# EasyEDA Pro project jackt-tong-yong-xiao-che-kong-zhi-qi-zhuan-li-948f377a.epro, schematic v5.1SCH

## Sheets
1 v5.1电源: Board Name: GCARCv5; Create Date: 2024-10-29; Page Name: 电源; Project Name: 通用小车控制器; Schematic Name: v5SCH; Update Date: 2024-11-05; Company: 深圳嘉立创科技发展有限公司; Drawed: 嘉立创EDA; Page Size: A3; Part Number: JLCPCB-001; Reviewed: 嘉立创EDA; Version: V0.1
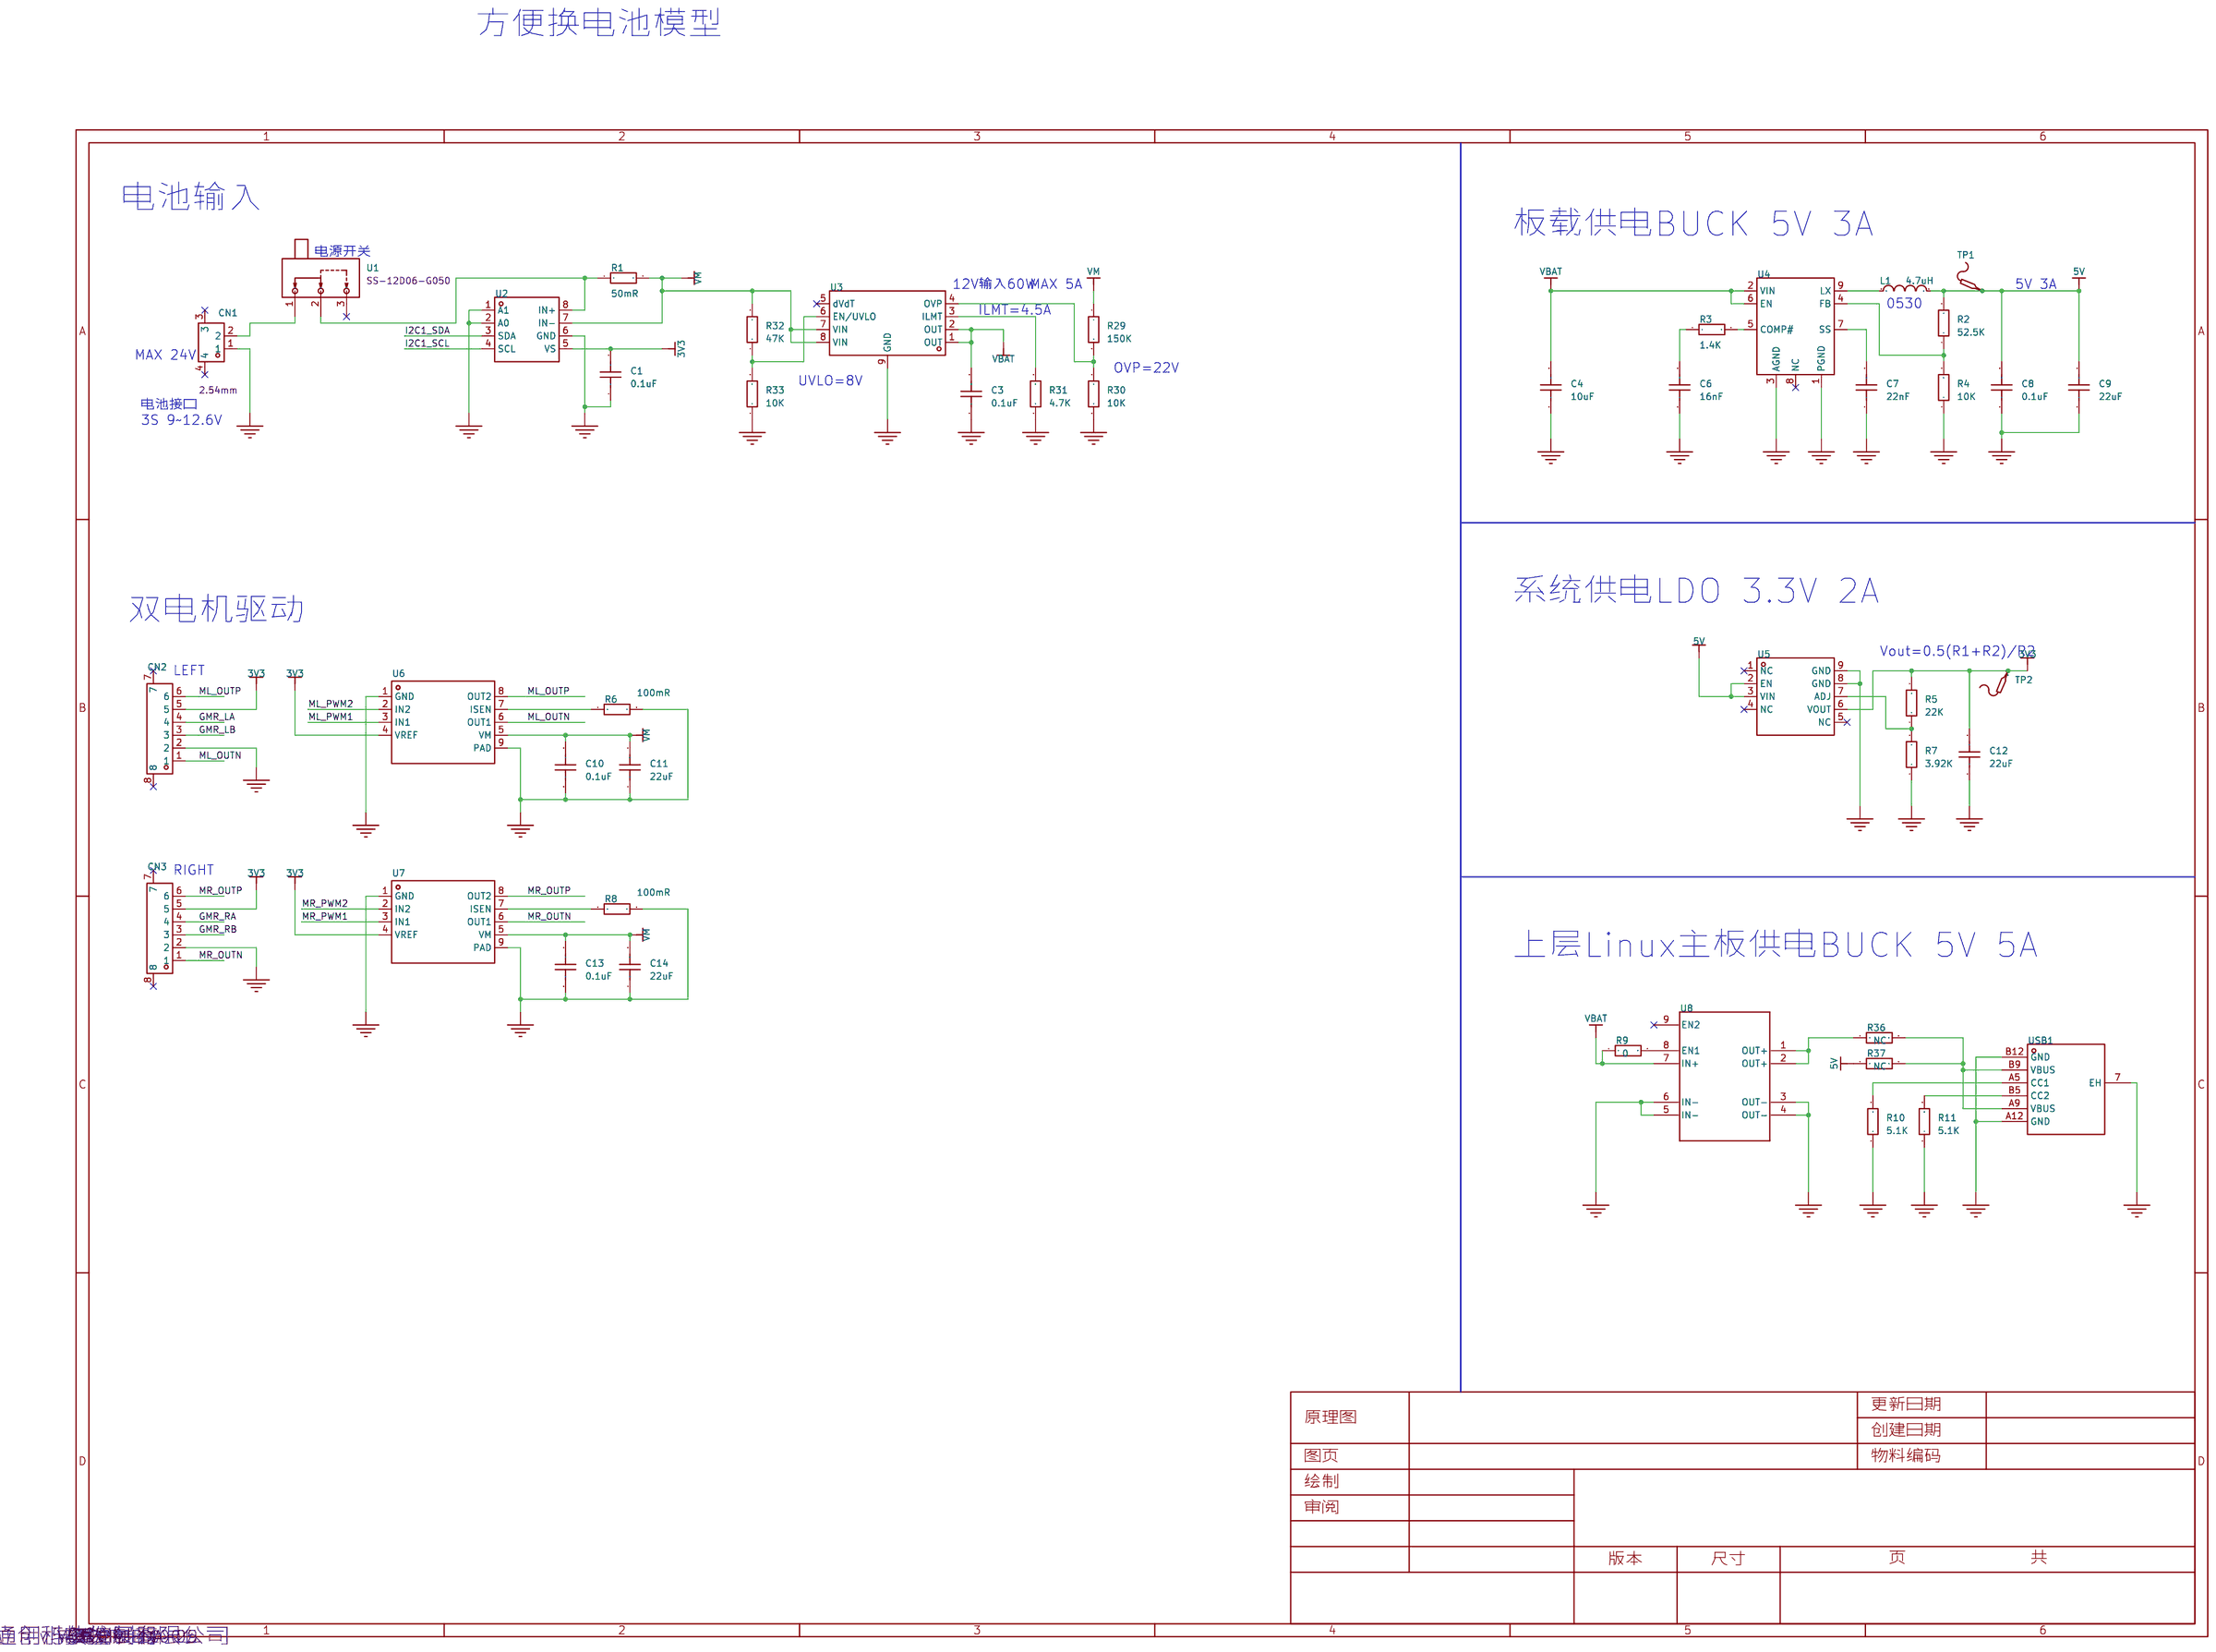
[diagram p2: v5.1电源]
2 v5.1功能: Board Name: GCARCv5_1; Create Date: 2024-11-23; Page Name: v5.1功能; Schematic Name: v5.1SCH; Update Date: 2024-11-28
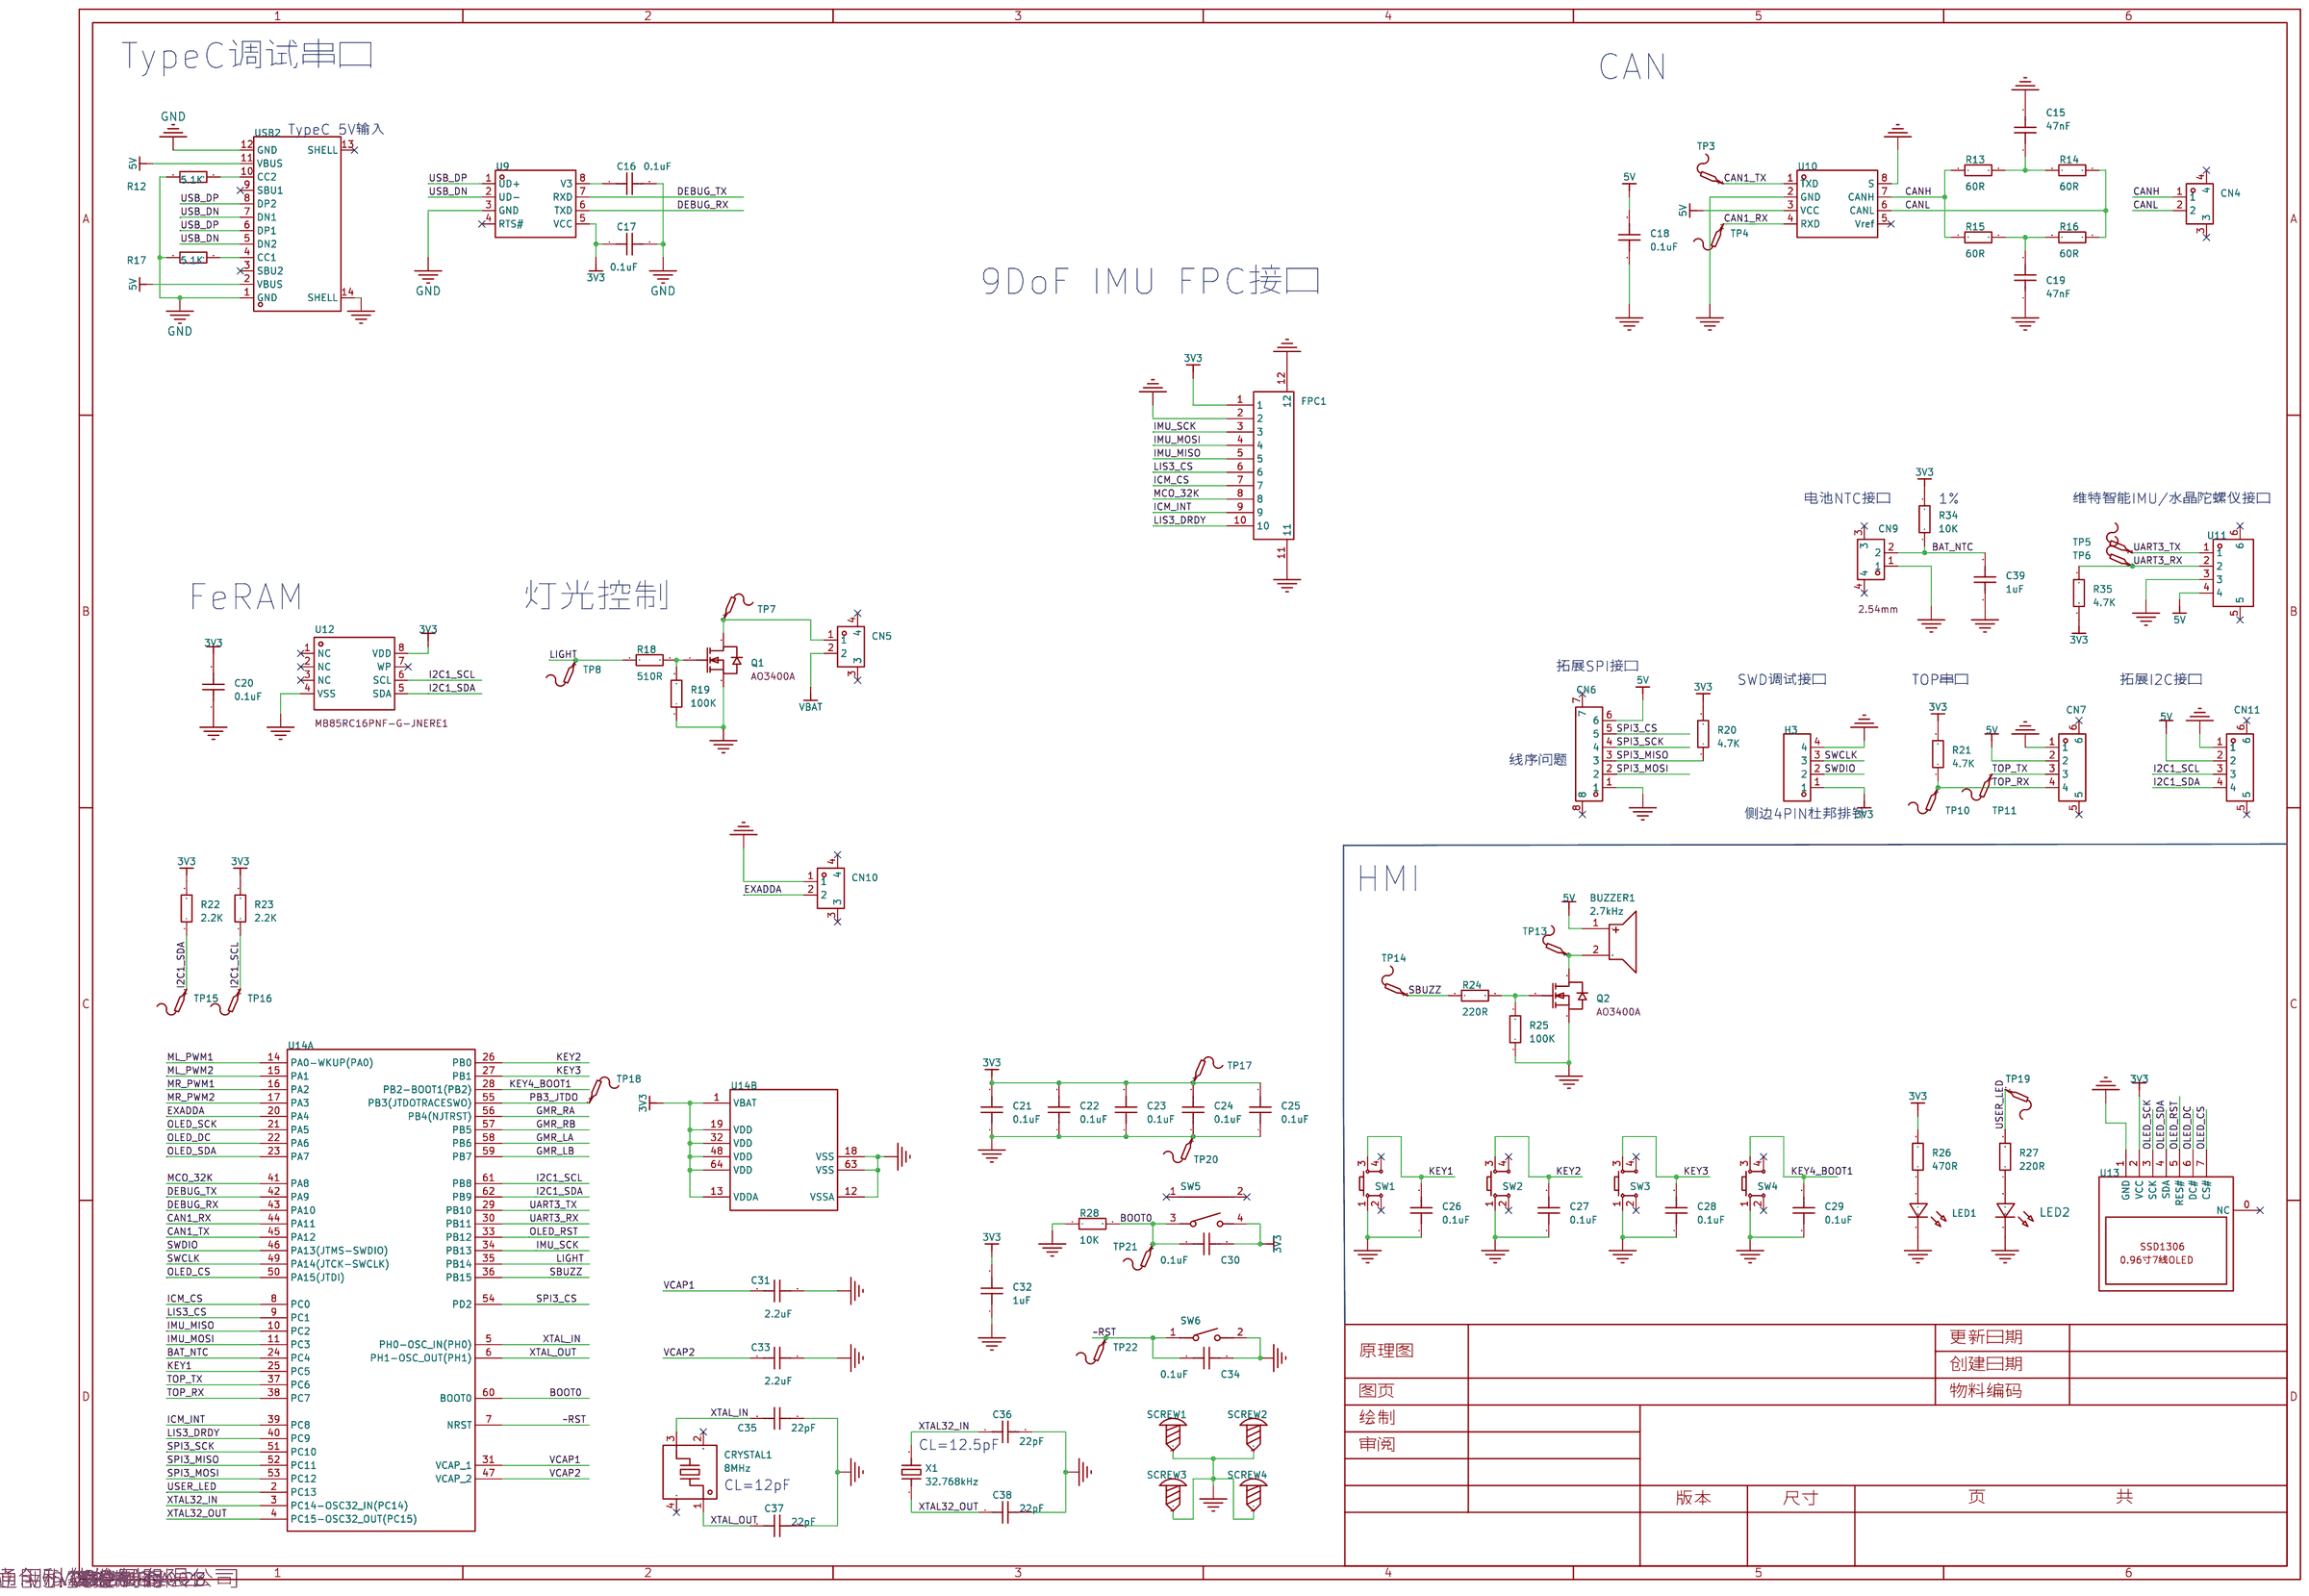
[diagram p3: v5.1功能]

## Parts
sheet v5.1功能
BUZZER1  2.7kHz  [BUZ-SMD_L9.6-W9.6-LS10.0-R]
C15  47nF  [C0603]
C16  0.1uF  [C0603]
C17  0.1uF  [C0603]
C18  0.1uF  [C0603]
C19  47nF  [C0603]
C20  0.1uF  [C0603]
C21  0.1uF  [C0603]
C22  0.1uF  [C0603]
C23  0.1uF  [C0603]
C24  0.1uF  [C0603]
C25  0.1uF  [C0603]
C26  0.1uF  [C0603]
C27  0.1uF  [C0603]
C28  0.1uF  [C0603]
C29  0.1uF  [C0603]
C30  0.1uF  [C0603]
C31  2.2uF  [C0603]
C32  1uF  [C0603]
C33  2.2uF  [C0603]
C34  0.1uF  [C0603]
C35  22pF  [C0603]
C36  22pF  [C0603]
C37  22pF  [C0603]
C38  22pF  [C0603]
C39  1uF  [C0603]
CN4  ZX-XH2.54-2PWT  [CONN-SMD_2P-P2.54_MEGASTAR_ZX-XH2.54-2PWT]
CN5  ZX-XH2.54-2PWT  [CONN-SMD_2P-P2.54_MEGASTAR_ZX-XH2.54-2PWT]
CN6  HCZZ0021-6  [CONN-SMD_HCZZ0021-6]
CN7  XDWF-2500-04P  [CONN-SMD_4P-P2.54_MXXH-2.54-04P-WT1-0-A]
CN9  ZX-XH2.54-2PWT  [CONN-SMD_2P-P2.54_MEGASTAR_ZX-XH2.54-2PWT]
CN10  ZX-XH2.54-2PWT  [CONN-SMD_2P-P2.54_MEGASTAR_ZX-XH2.54-2PWT]
CN11  XDWF-2500-04P  [CONN-SMD_4P-P2.54_MXXH-2.54-04P-WT1-0-A]
CRYSTAL1  8MHz  [CRYSTAL-SMD_4P-L3.2-W2.5-BL_SIT8008BI]
FPC1  AFC01-S10FCA-00  [FPC-SMD_P0.5-10P_FGS-XJ-H2.0]
H3  PZ254R-11-04P  [HDR-TH_4P-P2.54-H-M-W10.4]
LED1  -  [LED_0603]
LED2  -  [LED_0603]
Q1  AO3400A  [SOT-23-3_L2.9-W1.6-P1.90-LS2.8-BR]
Q2  AO3400A  [SOT-23-3_L2.9-W1.6-P1.90-LS2.8-BR]
R12  5.1K  [R0603]
R13  60R  [R0603]
R14  60R  [R0603]
R15  60R  [R0603]
R16  60R  [R0603]
R17  5.1K  [R0603]
R18  510R  [R0603]
R19  100K  [R0603]
R20  4.7K  [R0603]
R21  4.7K  [R0603]
R22  2.2K  [R0603]
R23  2.2K  [R0603]
R24  220R  [R0603]
R25  100K  [R0603]
R26  470R  [R0603]
R27  220R  [R0603]
R28  10K  [R0603]
R34  10K  [R0603]
R35  4.7K  [R0603]
SCREW1  -  [M3螺丝]
SCREW2  -  [M3螺丝]
SCREW3  -  [M3螺丝]
SCREW4  -  [M3螺丝]
SW1  -  [SW-TH_4P-L6.0-W6.0-P4.50-LS6.5]
SW2  -  [SW-TH_4P-L6.0-W6.0-P4.50-LS6.5]
SW3  -  [SW-TH_4P-L6.0-W6.0-P4.50-LS6.5]
SW4  -  [SW-TH_4P-L6.0-W6.0-P4.50-LS6.5]
SW5  TS24CA  [SW-SMD_TS24CA]
SW6  TS-1088-AR02016  [SW-SMD_L3.9-W3.0-P4.45]
TP3  -  [Test-Point-0.5mm]
TP4  -  [Test-Point-0.5mm]
TP5  -  [Test-Point-0.5mm]
TP6  -  [Test-Point-0.5mm]
TP7  -  [Test-Point-0.5mm]
TP8  -  [Test-Point-0.5mm]
TP10  -  [Test-Point-0.5mm]
TP11  -  [Test-Point-0.5mm]
TP13  -  [Test-Point-0.5mm]
TP14  -  [Test-Point-0.5mm]
TP15  -  [Test-Point-0.5mm]
TP16  -  [Test-Point-0.5mm]
TP17  -  [Test-Point-0.5mm]
TP18  -  [Test-Point-0.5mm]
TP19  -  [Test-Point-0.5mm]
TP20  -  [Test-Point-0.5mm]
TP21  -  [Test-Point-0.5mm]
TP22  -  [Test-Point-0.5mm]
U9  CH340N  [SOP-8_L4.9-W3.9-P1.27-LS6.0-BL]
U10  TJA1050T-JSM  [SOIC-8_L4.9-W3.9-P1.27-LS6.0-BL]
U11  WAFER-GH1.25-4PWB  [CONN-SMD_4P-P1.25_XUNPU_WAFER-GH1.25-4PWB]
U12  MB85RC16PNF-G-JNERE1  [SOIC-8_L4.9-W3.9-P1.27-LS6.0-BL]
U13  -  [0.96寸7针OLED]
U14  STM32F405RGT6  [LQFP-64_L10.0-W10.0-P0.50-LS12.0-BL]  (sections 1,2)
USB2  TYPE-C 16PIN 2MD(073)  [USB-C-SMD_TYPE-C-6PIN-2MD-073]
X1  32.768kHz  [OSC-SMD_L3.2-W1.5]
sheet v5.1电源
C1  0.1uF  [C0603]
C3  0.1uF  [C0603]
C4  10uF  [C0805]
C6  16nF  [C0603]
C7  22nF  [C0603]
C8  0.1uF  [C0603]
C9  22uF  [C0805]
C10  0.1uF  [C0603]
C11  22uF  [C1206]
C12  22uF  [C0805]
C13  0.1uF  [C0603]
C14  22uF  [C1206]
CN1  ZX-XH2.54-2PWT  [CONN-SMD_2P-P2.54_MEGASTAR_ZX-XH2.54-2PWT]
CN2  HCZZ0021-6  [CONN-SMD_HCZZ0021-6]
CN3  HCZZ0021-6  [CONN-SMD_HCZZ0021-6]
L1  4.7uH  [IND-SMD_L5.4-W5.2_FXL0530]
R1  50mR  [R1206]
R2  52.5K  [R0603]
R3  1.4K  [R0603]
R4  10K  [R0603]
R5  22K  [R0603]
R6  100mR  [R1206]
R7  3.92K  [R0603]
R8  100mR  [R1206]
R9  0  [R0402]
R10  5.1K  [R0603]
R11  5.1K  [R0603]
R29  150K  [R0603]
R30  10K  [R0603]
R31  4.7K  [R0603]
R32  47K  [R0603]
R33  10K  [R0603]
R36  NC  [R0402]
R37  NC  [R0402]
TP1  -  [Test-Point-0.5mm]
TP2  -  [Test-Point-0.5mm]
U1  SS-12D06-G050  [SW-TH_3P-P4.70_SS-12D06-G050]
U2  INA219AID  [SOIC-8_L4.9-W3.9-P1.27-LS6.0-BL]
U3  MX25947ES  [ESOP-8_L4.9-W3.9-P1.27-LS6.0-BL-EP-1]
U4  ME3118ASPG  [ESOP-8_L4.9-W3.9-P1.27-LS6.0-BL-EP]
U5  RT2515HGSP  [SOP-8_L4.9-W3.9-P1.27-LS6.0-BL-EP]
U6  DRV8870DDAR  [HSOP-8_L5.0-W4.0-P1.27-LS6.2-BL-EP]
U7  DRV8870DDAR  [HSOP-8_L5.0-W4.0-P1.27-LS6.2-BL-EP]
U8  XN-50L  [小聂studio-5V稳压]
USB1  TYPE-C 6P(073)  [TYPE-C-SMD_TYPE-C-6P_5]

## Library data of the parts
BUZZER1 = MLT-9650: 驱动方式:有源(内含驱动线路);构造类型:电磁式;频率:2.7kHz;声压(SPL):85dB@5V,10cm;; LCSC Part Name: 耐环保MLT-9650; Supplier Part: C96127; Manufacturer: 华能; JLCPCB Part Class: 扩展库; Datasheet: https://atta.szlcsc.com/upload/public/pdf/source/20170914/C96127_1505374148680969227.pdf; Supplier: LCSC; Oscillator Circuit: 有源(内含驱动线路); Technology Type: 电磁式; Operating Voltage: 3V~7V; Sound Pressure Level (SPL): 85dB@5V,10cm; Length: 9.6mm; Width: 9.6mm; Height: 5.5mm
C1 C3 C6-C8 C10 C13 C15-C39 = CAP_0603: Supplier Footprint: 0603
CN1 CN4 CN5 CN9 CN10 = ZX-XH2.54-2PWT: 插针结构:1x2P;间距:2.54mm;安装方式:卧贴;参考系列:XH;总PIN数:2P;排数:1;每排PIN数:2;行距:-;额定电流:3A;触头材质:黄铜;触头镀层:锡;工作温度范围:-25℃~+85℃;; Supplier Part: C7429671; Manufacturer: Megastar(兆星); Supplier Footprint: SMD,P=2.54mm,卧贴; JLCPCB Part Class: 扩展库; Datasheet: https://atta.szlcsc.com/upload/public/pdf/source/20230619/D2020A0565D707024C90AEAD14B7AF42.pdf; Supplier: LCSC; Pins Structure: 1x2P; Pitch: 2.54mm; Mounting Style: 卧贴; Reference Series: XH; Number of Pins: 2P; Number of Rows: 1; Number of PINs Per Row: 2; Current Rating (Max): 3A; Contact Material: 黄铜; Contact Plating: 锡; Operating Temperature Range: -25℃~+85℃
CN2 CN3 CN6 = HCZZ0021-6: 插针结构:1x6P;间距:2.54mm;安装方式:卧贴;参考系列:XH;总PIN数:6P;排数:1;每排PIN数:6;额定电流:3A;触头材质:黄铜;触头镀层:锡;工作温度范围:-25℃~+85℃;; LCSC Part Name: 1x6P 间距:2.54mm 卧贴 系列:XH 米色; Supplier Part: C7433711; Manufacturer: HC(虹成电子); Supplier Footprint: SMD,P=2.54mm,卧贴; JLCPCB Part Class: 扩展库; Datasheet: https://atta.szlcsc.com/upload/public/pdf/source/20230707/EBD34B2F45667F1DC530D7576BB95823.pdf; Supplier: LCSC; Pins Structure: 1x6P; Pitch: 2.54mm; Mounting Style: 卧贴; Reference Series: XH; Number of Pins: 6P; Number of Rows: 1; Number of PINs Per Row: 6; Current Rating (Max): 3A; Contact Material: 黄铜; Contact Plating: 锡; Operating Temperature Range: -25℃~+85℃
CN7 CN11 = XDWF-2500-04P: 间距:2.54mm;安装方式:卧贴;参考系列:XH;总PIN数:4P;额定电流:4A;工作温度范围:-40℃~+85℃;; LCSC Part Name: 间距:2.54mm 卧贴 系列:XH; Supplier Part: C19723931; Manufacturer: LX(连欣科技); Supplier Footprint: SMD,P=2.5mm,卧贴; JLCPCB Part Class: 扩展库; Datasheet: https://atta.szlcsc.com/upload/public/pdf/source/20231222/6CB0E40CA6FFE63C5D87C69622E580AB.pdf; Supplier: LCSC; Pitch: 2.54mm; Mounting Style: 卧贴; Reference Series: XH; Number of Pins: 4P; Current Rating (Max): 4A; Operating Temperature Range: -40℃~+85℃
CRYSTAL1 = CF4008M00012001: 晶振类型:贴片晶振;频率:8MHz;常温频差:±10ppm;外接负载电容:12pF;频率稳定度(全温):±30ppm;; LCSC Part Name: 8MHz ±10ppm 12pF; Supplier Part: C7294546; Manufacturer: HUAXIN(华昕); Supplier Footprint: SMD-3225-4P; JLCPCB Part Class: 扩展库; Datasheet: https://atta.szlcsc.com/upload/public/pdf/source/20230614/403FD538918E19EFAFACD07D4A487DFF.pdf; Supplier: LCSC; Crystal Type: 贴片晶振; Normal temperature Frequency Tolerance: ±10ppm; External load capacitor: 12pF; Frequency Stability(Full temperature range): ±30ppm; Equivalent Series Resistance (ESR): 40Ω; Operating Temperature: -40℃~+85℃
FPC1 = AFC01-S10FCA-00: 锁定特性:翻盖式;触点类型:下接;触点数量:10P;间距:0.5mm;安装类型:卧贴;; LCSC Part Name: 间距:0.5mm P数:10P 翻盖式 下接; Supplier Part: C262659; Manufacturer: JS(钜硕电子); Supplier Footprint: SMD,P=0.5mm,卧贴; JLCPCB Part Class: 扩展库; Datasheet: https://atta.szlcsc.com/upload/public/pdf/source/20190816/C413942_2A72D1AC756EAE17EEDF756A339D4500.pdf; Supplier: LCSC; Locking Feature: 翻盖式; Contact Type: 下接; Number of Contacts: 10P; Pitch: 0.5mm; Mounting Type: 卧贴; FFC, FCB Thickness: 0.3mm; Height Above Board: 2mm
H3 = PZ254R-11-04P: 插针结构:1x4P;间距:2.54mm;行距:-;圆针/方针:方针;安装类型:弯插;排数:单排;总PIN位数:4P;额定电流:-;额定电压:-;配合针长度:6mm;塑高:2.5mm;触头材质:黄铜;触头镀层:-;工作温度范围:-40℃~+105℃;颜色:黑色;; LCSC Part Name: 间距:2.54mm 1x4P 弯插 方针; Supplier Part: C492412; Manufacturer: XFCN(兴飞); Supplier Footprint: 弯插,P=2.54mm; JLCPCB Part Class: 扩展库; Datasheet: https://atta.szlcsc.com/upload/public/pdf/source/20200309/C492412_B0EFFC1946AB079B8871416C4A09EF6C.pdf; Supplier: LCSC; Pin Structure: 1x4P; Pitch: 2.54mm; Circluar Pins/Square Pins: 方针; Mounting Type: 弯插; Number of Rows: 单排; Number of Pins: 4P; Length of Mating Pin: 6mm; Insulation Height: 2.5mm; Contact Material: 黄铜; Operating Temperature Range: -40℃~+105℃; Color: 黑色
LED1 = LED_0603-G: Supplier Footprint: 0603
LED2 = LED_0603-R: Supplier Footprint: 0603
Q1 Q2 = AO3400A_C20917: 类型:1个N沟道;漏源电压(Vdss):30V;连续漏极电流(Id):5.7A;功率(Pd):1.4W;导通电阻(RDS(on)@Vgs,Id):26.5mΩ@10V,5.7A;阈值电压(Vgs(th)@Id):1.5V@250uA;; LCSC Part Name: 1个N沟道 耐压:30V 电流:5.7A; Supplier Part: C20917; Manufacturer: AOS; Supplier Footprint: SOT-23-3L; JLCPCB Part Class: 基础库; Datasheet: https://atta.szlcsc.com/upload/public/pdf/source/20140107/1457706668533.pdf; Supplier: LCSC; Type: 1个N沟道; Drain Source Voltage (Vdss): 30V; Continuous Drain Current (Id): 5.7A; Power Dissipation (Pd): 1.4W; Drain Source On Resistance (RDS(on)@Vgs,Id): 26.5mΩ@10V,5.7A; Gate Threshold Voltage (Vgs(th)@Id): 1.5V@250uA; Total Gate Charge (Qg@Vgs): 7nC@4.5V; Input Capacitance (Ciss@Vds): 630pF@15V; Operating Temperature: -55℃~+150℃@(Tj)
R2-R5 R7 R10-R35 = Res_0603: Supplier Footprint: 0603
SCREW1-SCREW4 = M3螺丝: Supplier Footprint: 插件
SW1-SW4 = Key_TH_6x6x6: 触点电流:50mA;额定电压(DC):12V;绝缘电阻:100MΩ;电路结构:单刀单掷;安装方式:直插;按钮形状:圆形按钮;按钮/盖帽颜色:黑色;作用力:260gf@±30gf;工作温度:-25℃~+70℃;引脚样式:PC引脚;开关长度:6mm;开关宽度:6mm;开关高度:6mm;带支架:否;; Supplier Part: C2837516; Supplier Footprint: 插件
SW5 = TS24CA: 电路结构:单刀单掷;按钮形状:矩形按钮;安装方式:卧贴;开关长度:4.55mm;开关宽度:1.8mm;开关高度:3.5mm;触点电流:50mA;额定电压(DC):12V;带灯:-;机械寿命:-;; LCSC Part Name: 4.55*1.8*3.5mm 卧贴 轻触开关; Supplier Part: C393942; Manufacturer: SHOU HAN(首韩); Supplier Footprint: SMD; JLCPCB Part Class: 扩展库; Datasheet: https://atta.szlcsc.com/upload/public/pdf/source/20190521/C393942_591A9E318887EFA4274D34029981AD99.pdf; Supplier: LCSC; Circuit: 单刀单掷; Actuator Style: 矩形按钮; Mounting Style: 卧贴; Switch Length: 4.55mm; Switch Width: 1.8mm; Switch Height: 3.5mm; Contact Current: 50mA; Voltage Rating (DC): 12V
SW6 = TS-1088-AR02016: 电路结构:单刀单掷;按钮形状:圆形按钮;作用力:160gf;安装方式:立贴;开关长度:4mm;开关宽度:3mm;开关高度:2mm;带支架:不带;触点电流:50mA;额定电压(DC):12V;绝缘电阻:100MΩ;机械寿命:10万次;; LCSC Part Name: 4*3*2mm 立贴 轻触开关; Supplier Part: C720477; Manufacturer: XUNPU(讯普); Supplier Footprint: SMD; JLCPCB Part Class: 扩展库; Datasheet: https://atta.szlcsc.com/upload/public/pdf/source/20200810/C720475_60D09DD6C54279ADDB2DC25100F1CC11.pdf; Supplier: LCSC; Circuit: 单刀单掷; Actuator Style: 圆形按钮; Operating Force: 160gf; Mounting Style: 立贴; Switch Length: 4mm; Switch Width: 3mm; Switch Height: 2mm; Strike Gundam: 不带; Contact Current: 50mA; Voltage Rating (DC): 12V; Insulation Resistance: 100MΩ; Actuator/Cap Color: 黑色; Pin Style: SMD接片; Mechanical Life: 10万次; Operating Temperature: -30℃~+80℃
TP1-TP8 TP10 TP11 TP13-TP22 = Test-Point: Test Point 测试点
U9 = CH340N: Supplier Part: C2977777; Manufacturer: WCH(南京沁恒); Supplier Footprint: SOP-8; JLCPCB Part Class: Extended Part; Datasheet: https://atta.szlcsc.com/upload/public/pdf/source/20220223/82A45E4FF89B3EDCAD50B354450A7EF4.pdf; Supplier: LCSC
U10 = TJA1050T-JSM: LCSC Part Name: TJA1050T; Supplier Part: C21714366; Manufacturer: JSMSEMI(杰盛微); Supplier Footprint: SOP-8; JLCPCB Part Class: 扩展库; Datasheet: https://atta.szlcsc.com/upload/public/pdf/source/20240307/226A42A673340FFB74D7F8B5A383F6D1.pdf; Supplier: LCSC
U11 = WAFER-GH1.25-4PWB: 插针结构:1x4P;间距:1.25mm;安装方式:卧贴;参考系列:GH;总PIN数:4P;排数:1;每排PIN数:4;额定电流:1A;工作温度范围:-25℃~+85℃;; LCSC Part Name: 1x4P 间距:1.25mm 卧贴 系列:GH; Supplier Part: C3029379; Manufacturer: XUNPU(讯普); Supplier Footprint: SMD,P=1.25mm,卧贴; JLCPCB Part Class: 扩展库; Datasheet: https://atta.szlcsc.com/upload/public/pdf/source/20220527/CB8773BFB0913C3B8ABD62CB38BA101A.pdf; Supplier: LCSC; Pins Structure: 1x4P; Pitch: 1.25mm; Mounting Style: 卧贴; Reference Series: GH; Number of Pins: 4P; Number of Rows: 1; Number of PINs Per Row: 4; Current Rating (Max): 1A; Operating Temperature Range: -25℃~+85℃
U12 = MB85RC16PNF-G-JNERE1: 16-Kbit(2K × 8bit)，I2C接口，工作电压：2.7V to 3.6V; Supplier Part: C8739; Manufacturer: FUJITSU(富士通); Supplier Footprint: SOIC-8; JLCPCB Part Class: 扩展库; Datasheet: https://atta.szlcsc.com/upload/public/pdf/source/20120811/1457706526125.pdf; Supplier: LCSC
U13 = 0.96寸7针OLED
U14 = STM32F405RGT6: CPU内核:ARM-M4;程序存储容量:1MB;RAM总容量:192KB;GPIO端口数量:51;工作电压范围:1.8V~3.6V;CPU最大主频:168MHz;程序存储器类型:FLASH;; LCSC Part Name: 带DSP和FPU的高性能基础系列ARM Cortex-M4 MCU，具有1 MB Flash、168 MHz CPU和ART加速器; Supplier Part: C15742; Manufacturer: ST(意法半导体); Supplier Footprint: LQFP-64(10x10); JLCPCB Part Class: 扩展库; Datasheet: https://atta.szlcsc.com/upload/public/pdf/source/20140801/1457707197138.pdf; Supplier: LCSC; CPU Core: ARM-M4; Program Storage Size: 1MB; RAM Size: 192KB; GPIO Ports Number: 51; Operating Voltage Range: 1.8V~3.6V; CPU Maximum Speed: 168MHz; Program Memory Type: FLASH; Operating Temperature Range: -40℃~+85℃; ADC (Bit): 12bit; DAC (Bit): 12bit; Universal Serial Bus: 有; Peripheral/Function: DMA；LCD/LED驱动；PWM; Watchdog: 有; Infrared Data Association: 有; Low-Voltage Detect: 有; LCD Module: 有; Direct Memory Access: 有; Internal Oscillator: 有
USB2 = TYPE-C 16PIN 2MD(073): 连接器类型:Type-C;标准:-;公母:母;触点数量:16P;端口数量:1;安装方式:卧贴;额定电流 - 电源:5A;工作温度范围:-25℃~+85℃;; LCSC Part Name: Type-C 母 卧贴 带定位柱 不锈钢外壳 2次模顶; Supplier Part: C2765186; Manufacturer: SHOU HAN(首韩); Supplier Footprint: SMD; JLCPCB Part Class: 扩展库; Datasheet: https://atta.szlcsc.com/upload/public/pdf/source/20211123/39B17C16241EAC15C5E277BDA434118E.pdf; Supplier: LCSC; Connector Type: Type-C; Gender: 母; Number of Contacts: 16P; Number of Ports: 1; Mounting Style: 卧贴; Current Rating - Power (Max): 5A; Operating Temperature Range: -25℃~+85℃
X1 = X321532768KGD2SI: 晶振类型:贴片晶振;频率:32.768kHz;常温频差:±20ppm;外接负载电容:12.5pF;频率稳定度(全温):-;; LCSC Part Name: 32.768kHz ±20ppm 12.5pF; Supplier Part: C620155; Manufacturer: YXC(扬兴晶振); Supplier Footprint: SMD3215-2P; JLCPCB Part Class: 扩展库; Datasheet: https://atta.szlcsc.com/upload/public/pdf/source/20240329/3A7650FD985DD0DE85694D3785AB4916.pdf; Supplier: LCSC; Crystal Type: 贴片晶振; Normal temperature Frequency Tolerance: ±20ppm; External load capacitor: 12.5pF; Operating Temperature: -40℃~+85℃
C4 C9 C12 = CAP_0805: Supplier Footprint: 0805
C11 C14 = CAP_1206: Supplier Footprint: 1206
L1 = FXL0530-4R7-M: 电感值:4.7uH;精度:±20%;额定电流:4.5A;饱和电流(Isat):5A;类型:一体成型电感;; LCSC Part Name: 4.7uH ±20% 5A; Supplier Part: C177246; Manufacturer: cjiang(长江微电); Supplier Footprint: SMD,5.2x5.4mm; JLCPCB Part Class: 扩展库; Datasheet: https://atta.szlcsc.com/upload/public/pdf/source/20240426/3189EA8206330E2108542F9E34E540E7.pdf; Supplier: LCSC; Tolerance: ±20%; Rated Current: 4.5A; Saturation Current (Isat): 5A; DC Resistance (DCR): 60mΩ; Type: 一体成型电感
R1 R6 R8 = Res_1206: Supplier Footprint: 1206
R9 R36 R37 = Res_0402: Supplier Footprint: 0402
U1 = SS-12D06-G050: 电路结构:单刀双掷;安装方式:-;开关颜色:黑色;额定电流(DC):3A;额定电压(DC):250V;机械寿命:1万次;; LCSC Part Name: SS-12D06 大电流拨动开关 G5.0柄; Supplier Part: C17179521; Manufacturer: G-Switch(品赞); Supplier Footprint: 插件,12.7x6.6x6.4mm; JLCPCB Part Class: 扩展库; Datasheet: https://atta.szlcsc.com/upload/public/pdf/source/20230915/62770FED7A7C5A08D3E9F9C8FE01EA01.pdf; Supplier: LCSC; Circuit: 单刀双掷; Actuator Color: 黑色; Current Rating (DC): 3A; Voltage Rating (DC): 250V; Mechanical Life: 1万次
U2 = INA219AID: INA219 26V 12 位 I2C 输出数字功率监测器; Supplier Part: C1574856; Manufacturer: TI(德州仪器); Supplier Footprint: SOIC-8; JLCPCB Part Class: 扩展库; Datasheet: https://www.ti.com/cn/lit/gpn/ina219; Supplier: LCSC
U3 = MX25947ES: LCSC Part Name: E-Fuse,过流过压保护电子保险丝; Supplier Part: C5875698; Manufacturer: Wuxi Maxinmicro(无锡明芯微); Supplier Footprint: ESOP8; JLCPCB Part Class: 扩展库; Datasheet: https://atta.szlcsc.com/upload/public/pdf/source/20230807/9BF31B0D8D7804D3094962F85E818A14.pdf; Supplier: LCSC
U4 = ME3118ASPG: Supplier Part: C427570; Manufacturer: MICRONE(南京微盟); Supplier Footprint: ESOP-8; JLCPCB Part Class: 扩展库; Datasheet: https://atta.szlcsc.com/upload/public/pdf/source/20190910/C427570_63BC38AC59EF2AB1407F891CB9220CCC.pdf; Supplier: LCSC
U5 = RT2515HGSP: 输出类型:可调;最大输入电压:6V;输出电压:900mV~5.5V;最大输出电流:2A;电源纹波抑制比(PSRR):-;输出极性:正极;; LCSC Part Name: ADJ 输入6V 输出0.9V~5.5V 2A; Supplier Part: C242642; Manufacturer: RICHTEK(立锜); Supplier Footprint: SOP-8-EP; JLCPCB Part Class: 扩展库; Datasheet: https://atta.szlcsc.com/upload/public/pdf/source/20180629/C242642_AA21D3527C20C70CB74C1AE5985AD0C2.pdf; Supplier: LCSC; Output Type: 可调; Maximum Input Voltage: 6V; Output Voltage: 900mV~5.5V; MAX Output Current: 2A; Dropout Voltage: 400mV@(2A); Output Polarity: 正极; Number of Outputs: 1
U6 U7 = DRV8870DDAR: DRV8870 具有电流调节功能的 50V、3.6A、H 桥电机驱动器; Supplier Part: C86590; Manufacturer: TI(德州仪器); Supplier Footprint: HSOP-8-EP; JLCPCB Part Class: 扩展库; Datasheet: https://www.ti.com/cn/lit/gpn/drv8870; Supplier: LCSC
U8 = XN-50L
USB1 = TYPE-C 6P(073): 连接器类型:Type-C;标准:USB 3.1;公母:母;安装方式:卧贴;触点数量:6P;端口数量:1;额定电流 - 电源:3A;工作温度范围:-25℃~+85℃;; LCSC Part Name: Type-C 母 卧贴; Supplier Part: C668623; Manufacturer: SHOU HAN(首韩); Supplier Footprint: SMD; JLCPCB Part Class: 扩展库; Datasheet: https://atta.szlcsc.com/upload/public/pdf/source/20200618/C668623_A4B260DED7AC1949BAC6AE39E9F4CD80.pdf; Supplier: LCSC; Connector Type: Type-C; Standard: USB 3.1; Gender: 母; Mounting Style: 卧贴; Number of Contacts: 6P; Number of Ports: 1; Current Rating - Power (Max): 3A; Operating Temperature Range: -25℃~+85℃; Rated Voltage (Max): 5V; Connect-Disconnect Life: 1万次; Core Colour: 黑色

## Nets
3V3: C1.2 C12.2 C17.1 C20.2 C21.2 C22.2 C23.2 C24.2 C25.2 C30.2 C32.2 CN2.5 CN3.5 FPC1.1 H3.1 R5.2 R20.2 R21.2 R22.2 R23.2 R26.2 R34.2 R35.1 SW5.4 TP2.1 TP17.1 U2.5(VS) U5.6(VOUT) U6.4(VREF) U7.4(VREF) U9.5(VCC) U12.8(VDD) U13.2(VCC) U14.1(VBAT) U14.13(VDDA) U14.19(VDD) U14.32(VDD) U14.48(VDD) U14.64(VDD)
5V: BUZZER1.1 C8.2 C9.2 C18.2 CN6.6 CN7.2 CN11.2 L1.2 R2.2 R37.1 TP1.1 U5.2(EN) U5.3(VIN) U10.3(VCC) U11.4 USB2.2(VBUS) USB2.11(VBUS)
GND: C1.1 C3.1 C4.1 C6.1 C7.1 C8.1 C9.1 C10.1 C11.1 C12.1 C13.1 C14.1 C15.2 C16.2 C17.2 C18.1 C19.1 C20.1 C21.1 C22.1 C23.1 C24.1 C25.1 C26.1 C27.1 C28.1 C29.1 C31.2 C32.1 C33.2 C34.2 C35.1 C36.2 C37.1 C38.2 C39.1 CN1.1 CN2.2 CN3.2 CN6.1 CN7.1 CN9.1 CN10.1 CN11.1 FPC1.2 FPC1.11 FPC1.12 H3.4 LED1.1(C) LED2.1(C) Q1.2(S) Q2.2(S) R4.1 R6.2 R7.1 R8.2 R10.1 R11.1 R12.1 R17.1 R19.1 R25.1 R28.1 R30.2 R31.1 R33.1 SCREW1.1 SCREW2.1 SCREW3.1 SCREW4.1 SW1.1 SW2.1 SW3.1 SW4.1 SW6.2 TP20.1 U2.1(A1) U2.2(A0) U2.6(GND) U3.9(GND) U4.1(PGND) U4.3(AGND) U5.8(GND) U5.9(GND) U6.1(GND) U6.9(PAD) U7.1(GND) U7.9(PAD) U8.3(OUT-) U8.4(OUT-) U8.5(IN-) U8.6(IN-) U9.3(GND) U10.2(GND) U10.8(S) U11.3 U12.4(VSS) U13.1(GND) U14.12(VSSA) U14.18(VSS) U14.63(VSS) USB1.7(EH) USB1.A12(GND) USB1.B12(GND) USB2.1(GND) USB2.12(GND) USB2.14(SHELL)
VBAT: C3.2 C4.2 CN5.2 R9.1 U3.1(OUT) U3.2(OUT) U4.2(VIN) U4.6(EN) U8.7(IN+)
BAT_NTC: C39.2 CN9.2 R34.1 U14.24(PC4)
BOOT0: C30.1 R28.2 SW5.3 TP21.1 U14.60(BOOT0)
CAN1_RX: TP4.1 U10.4(RXD) U14.44(PA11)
CAN1_TX: TP3.1 U10.1(TXD) U14.45(PA12)
CANH: CN4.1 R13.2 R15.2 U10.7(CANH)
CANL: CN4.2 R14.1 R16.1 U10.6(CANL)
DEBUG_RX: U9.6(TXD) U14.43(PA10)
DEBUG_TX: U9.7(RXD) U14.42(PA9)
EXADDA: CN10.2 U14.20(PA4)
GMR_LA: CN2.4 U14.58(PB6)
GMR_LB: CN2.3 U14.59(PB7)
GMR_RA: CN3.4 U14.56(PB4(NJTRST))
GMR_RB: CN3.3 U14.57(PB5)
I2C1_SCL: CN11.3 R23.1 TP16.1 U2.4(SCL) U12.6(SCL) U14.61(PB8)
I2C1_SDA: CN11.4 R22.1 TP15.1 U2.3(SDA) U12.5(SDA) U14.62(PB9)
ICM_CS: FPC1.7 U14.8(PC0)
ICM_INT: FPC1.9 U14.39(PC8)
IMU_MISO: FPC1.5 U14.10(PC2)
IMU_MOSI: FPC1.4 U14.11(PC3)
IMU_SCK: FPC1.3 U14.34(PB13)
KEY1: C26.2 SW1.3 U14.25(PC5)
KEY2: C27.2 SW2.3 U14.26(PB0)
KEY3: C28.2 SW3.3 U14.27(PB1)
KEY4_BOOT1: C29.2 SW4.3 U14.28(PB2-BOOT1(PB2))
LIGHT: R18.1 TP8.1 U14.35(PB14)
LIS3_CS: FPC1.6 U14.9(PC1)
LIS3_DRDY: FPC1.10 U14.40(PC9)
MCO_32K: FPC1.8 U14.41(PA8)
ML_OUTN: CN2.1 U6.6(OUT1)
ML_OUTP: CN2.6 U6.8(OUT2)
ML_PWM1: U6.3(IN1) U14.14(PA0-WKUP(PA0))
ML_PWM2: U6.2(IN2) U14.15(PA1)
MR_OUTN: CN3.1 U7.6(OUT1)
MR_OUTP: CN3.6 U7.8(OUT2)
MR_PWM1: U7.3(IN1) U14.16(PA2)
MR_PWM2: U7.2(IN2) U14.17(PA3)
OLED_CS: U13.7(CS#) U14.50(PA15(JTDI))
OLED_DC: U13.6(DC#) U14.22(PA6)
OLED_RST: U13.5(RES#) U14.33(PB12)
OLED_SCK: U13.3(SCK) U14.21(PA5)
OLED_SDA: U13.4(SDA) U14.23(PA7)
PB3_JTDO: TP18.1 U14.55(PB3(JTDOTRACESWO))
SBUZZ: R24.1 TP14.1 U14.36(PB15)
SPI3_CS: CN6.5 U14.54(PD2)
SPI3_MISO: CN6.3 R20.1 U14.52(PC11)
SPI3_MOSI: CN6.2 U14.53(PC12)
SPI3_SCK: CN6.4 U14.51(PC10)
SWCLK: H3.3 U14.49(PA14(JTCK-SWCLK))
SWDIO: H3.2 U14.46(PA13(JTMS-SWDIO))
TOP_RX: CN7.4 R21.1 TP10.1 U14.38(PC7)
TOP_TX: CN7.3 TP11.1 U14.37(PC6)
UART3_RX: R35.2 TP6.1 U11.2 U14.30(PB11)
UART3_TX: TP5.1 U11.1 U14.29(PB10)
USB_DN: U9.2(UD-) USB2.5(DN2) USB2.7(DN1)
USB_DP: U9.1(UD+) USB2.6(DP1) USB2.8(DP2)
USER_LED: R27.2 TP19.1 U14.2(PC13)
VCAP1: C31.1 U14.31(VCAP_1)
VCAP2: C33.1 U14.47(VCAP_2)
VM: C10.2 C11.2 C13.2 C14.2 R1.2 R29.1 R32.2 U2.7(IN-) U3.7(VIN) U3.8(VIN) U6.5(VM) U7.5(VM)
XTAL32_IN: C36.1 U14.3(PC14-OSC32_IN(PC14)) X1.2
XTAL32_OUT: C38.1 U14.4(PC15-OSC32_OUT(PC15)) X1.1
XTAL_IN: C35.2 CRYSTAL1.3 U14.5(PH0-OSC_IN(PH0))
XTAL_OUT: C37.2 CRYSTAL1.1 U14.6(PH1-OSC_OUT(PH1))
~RST: C34.1 SW6.1 TP22.1 U14.7(NRST)
$1N904: CN1.2 U1.1
$1N949: R1.1 U1.2 U2.8(IN+)
$1N1480: C7.2 U4.7(SS)
$1N1481: L1.1 U4.9(LX)
$1N1482: R2.1 R4.2 U4.4(FB)
$1N1489: C6.2 R3.1
$1N1491: R3.2 U4.5(COMP#)
$1N1811: R5.1 R7.2 U5.7(ADJ)
$1N2361: R8.1 U7.7(ISEN)
$1N2370: R6.1 U6.7(ISEN)
$1N4428: R9.2 U8.8(EN1)
$1N4483: R36.1 U8.1(OUT+) U8.2(OUT+)
$1N4878: R36.2 R37.2 USB1.A9(VBUS) USB1.B9(VBUS)
$1N4910: R10.2 USB1.A5(CC1)
$1N4914: R11.2 USB1.B5(CC2)
$1N7204: R29.2 R30.1 U3.4(OVP)
$1N8339: R31.2 U3.3(ILMT)
$1N8450: R32.1 R33.2 U3.6(EN/UVLO)
$2N586: C16.1 U9.8(V3)
$2N604: R17.2 USB2.4(CC1)
$2N609: R12.2 USB2.10(CC2)
$2N1216: C15.1 R13.1 R14.2
$2N1220: C19.2 R15.1 R16.2
$2N3644: LED1.2(A) R26.1
$2N3645: LED2.2(A) R27.1
$2N3871: Q2.1(G) R24.2 R25.2
$2N3874: BUZZER1.2 Q2.3(D) TP13.1
$2N4783: Q1.1(G) R18.2 R19.2
$2N4785: CN5.1 Q1.3(D) TP7.1

Not connected (* = marked no-connect by the designer): CN1 3* 4*; CN2 7* 8*; CN3 7* 8*; CN4 3* 4*; CN5 3* 4*; CN6 7* 8*; CN7 5* 6*; CN9 3* 4*; CN10 3* 4*; CN11 5* 6*; CRYSTAL1 2(GND)* 4(GND)*; SW1 2* 4*; SW2 2* 4*; SW3 2* 4*; SW4 2* 4*; SW5 1* 2*; U1 3*; U3 5(dVdT)*; U4 8(NC)*; U5 1(NC)* 4(NC)* 5(NC)*; U8 9(EN2)*; U9 4(RTS#)*; U10 5(Vref)*; U11 5* 6*; U12 1(NC)* 2(NC)* 3(NC)* 7(WP)*; U13 0(NC)*; USB2 3(SBU2)* 9(SBU1)* 13(SHELL)*

## Notes on the sheets
sheet 1
- 方便换电池模型
- 电池输入
- 板载供电BUCK 5V 3A
- 电源开关
- 12V输入60W
- MAX 5A
- 5V 3A
- ILMT=4.5A
- 0530
- MAX 24V
- OVP=22V
- UVLO=8V
- 电池接口
  3S 9~12.6V
- 系统供电LDO 3.3V 2A
- 双电机驱动
- Vout=0.5(R1+R2)/R2
- LEFT
- RIGHT
- 上层Linux主板供电BUCK 5V 5A
sheet 2
- TypeC调试串口
- CAN
- TypeC 5V输入
- 9DoF IMU FPC接口
- 电池NTC接口
- 1%
- 维特智能IMU/水晶陀螺仪接口
- FeRAM
- 灯光控制
- 拓展SPI接口
- SWD调试接口
- TOP串口
- 拓展I2C接口
- 线序问题
- 侧边4PIN杜邦排针
- HMI
- CL=12.5pF
- CL=12pF
